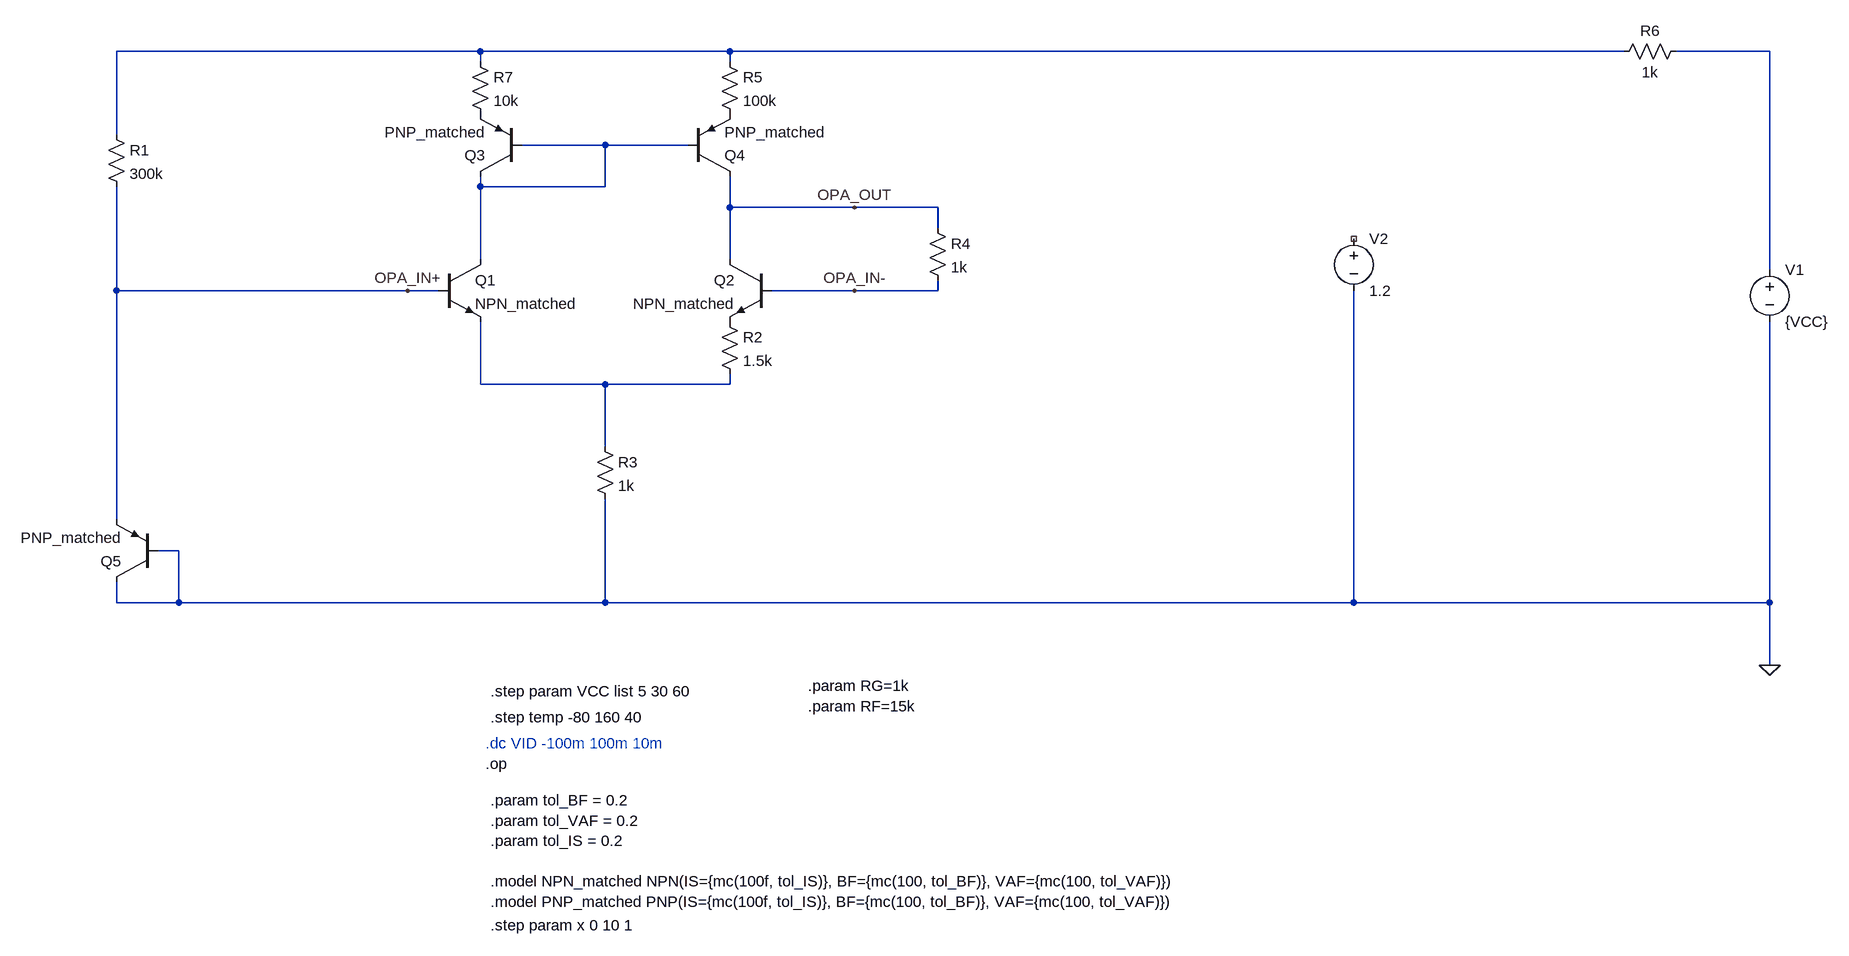
[diagram p0: schematic LV_OPA.asc]
LV_OPA.asc, the LTspice schematic file:
Version 4.1
SHEET 1 2020 1016
WIRE -656 -416 -1216 -416
WIRE -272 -416 -656 -416
WIRE 1104 -416 -272 -416
WIRE 1328 -416 1184 -416
WIRE -656 -400 -656 -416
WIRE -272 -400 -272 -416
WIRE -1216 -288 -1216 -416
WIRE -464 -272 -592 -272
WIRE -336 -272 -464 -272
WIRE -656 -208 -656 -224
WIRE -464 -208 -464 -272
WIRE -464 -208 -656 -208
WIRE -272 -176 -272 -224
WIRE -80 -176 -272 -176
WIRE 48 -176 -80 -176
WIRE 48 -144 48 -176
WIRE -656 -96 -656 -208
WIRE -272 -96 -272 -176
WIRE 1328 -80 1328 -416
WIRE -1216 -48 -1216 -208
WIRE -768 -48 -1216 -48
WIRE -720 -48 -768 -48
WIRE -80 -48 -208 -48
WIRE 48 -48 48 -64
WIRE 48 -48 -80 -48
WIRE -656 96 -656 0
WIRE -464 96 -656 96
WIRE -272 96 -272 80
WIRE -272 96 -464 96
WIRE -464 192 -464 96
WIRE -1216 304 -1216 -48
WIRE -1120 352 -1152 352
WIRE -1216 432 -1216 400
WIRE -1120 432 -1120 352
WIRE -1120 432 -1216 432
WIRE -464 432 -464 272
WIRE -464 432 -1120 432
WIRE 688 432 688 -48
WIRE 688 432 -464 432
WIRE 1328 432 1328 0
WIRE 1328 432 688 432
WIRE 1328 528 1328 432
FLAG 1328 528 0
FLAG -768 -48 OPA_IN+
FLAG -80 -48 OPA_IN-
FLAG -80 -176 OPA_OUT
SYMBOL voltage 1328 -96 R0
WINDOW 123 0 0 Left 0
WINDOW 39 0 0 Left 0
SYMATTR InstName V1
SYMATTR Value {VCC}
SYMBOL res -672 -416 R0
SYMATTR InstName R7
SYMATTR Value 10k
SYMBOL res -288 -416 R0
SYMATTR InstName R5
SYMATTR Value 100k
SYMBOL res 1200 -432 R90
WINDOW 0 0 56 VBottom 2
WINDOW 3 32 56 VTop 2
SYMATTR InstName R6
SYMATTR Value 1k
SYMBOL pnp -592 -224 R180
SYMATTR InstName Q3
SYMATTR Value PNP_matched
SYMBOL pnp -336 -224 M180
SYMATTR InstName Q4
SYMATTR Value PNP_matched
SYMBOL npn -720 -96 R0
SYMATTR InstName Q1
SYMATTR Value NPN_matched
SYMBOL npn -208 -96 M0
SYMATTR InstName Q2
SYMATTR Value NPN_matched
SYMBOL res -288 -16 R0
SYMATTR InstName R2
SYMATTR Value 1.5k
SYMBOL voltage 688 -144 R0
WINDOW 123 0 0 Left 0
WINDOW 39 0 0 Left 0
SYMATTR InstName V2
SYMATTR Value 1.2
SYMBOL pnp -1152 400 R180
SYMATTR InstName Q5
SYMATTR Value PNP_matched
SYMBOL res -480 176 R0
SYMATTR InstName R3
SYMATTR Value 1k
SYMBOL res -1232 -304 R0
SYMATTR InstName R1
SYMATTR Value 300k
SYMBOL res 32 -160 R0
SYMATTR InstName R4
SYMATTR Value 1k
TEXT -648 648 Left 2 ;.dc VID -100m 100m 10m
TEXT -640 608 Left 2 !.step temp -80 160 40
TEXT -640 736 Left 2 !.param tol_BF = 0.2\n.param tol_VAF = 0.2\n.param tol_IS = 0.2\n \n.model NPN_matched NPN(IS={mc(100f, tol_IS)}, BF={mc(100, tol_BF)}, VAF={mc(100, tol_VAF)})\n.model PNP_matched PNP(IS={mc(100f, tol_IS)}, BF={mc(100, tol_BF)}, VAF={mc(100, tol_VAF)})
TEXT -640 928 Left 2 !.step param x 0 10 1
TEXT -648 680 Left 2 !.op
TEXT -640 568 Left 2 !.step param VCC list 5 30 60
TEXT -152 560 Left 2 !.param RG=1k\n.param RF=15k

The netlist it stands for:
* LV_OPA.asc
V1 N002 0 {VCC}
R7 N001 P001 10k
R5 N001 P002 100k
R6 N002 N001 1k
Q3 N003 N003 P001 0 PNP_matched
Q4 OPA_OUT N003 P002 0 PNP_matched
Q1 N003 OPA_IN+ N004 0 NPN_matched
Q2 OPA_OUT OPA_IN- P003 0 NPN_matched
R2 P003 N004 1.5k
V2 NC_01 0 1.2
Q5 0 0 OPA_IN+ 0 PNP_matched
R3 N004 0 1k
R1 N001 OPA_IN+ 300k
R4 OPA_OUT OPA_IN- 1k
.model NPN NPN
.model PNP PNP
.lib standard.bjt
* .dc VID -100m 100m 10m
.step temp -80 160 40
.param tol_BF = 0.2
.param tol_VAF = 0.2
.param tol_IS = 0.2
.model NPN_matched NPN(IS={mc(100f, tol_IS)}, BF={mc(100, tol_BF)}, VAF={mc(100, tol_VAF)})
.model PNP_matched PNP(IS={mc(100f, tol_IS)}, BF={mc(100, tol_BF)}, VAF={mc(100, tol_VAF)})
.step param x 0 10 1
.op
.step param VCC list 5 30 60
.param RG=1k
.param RF=15k
.backanno
.end